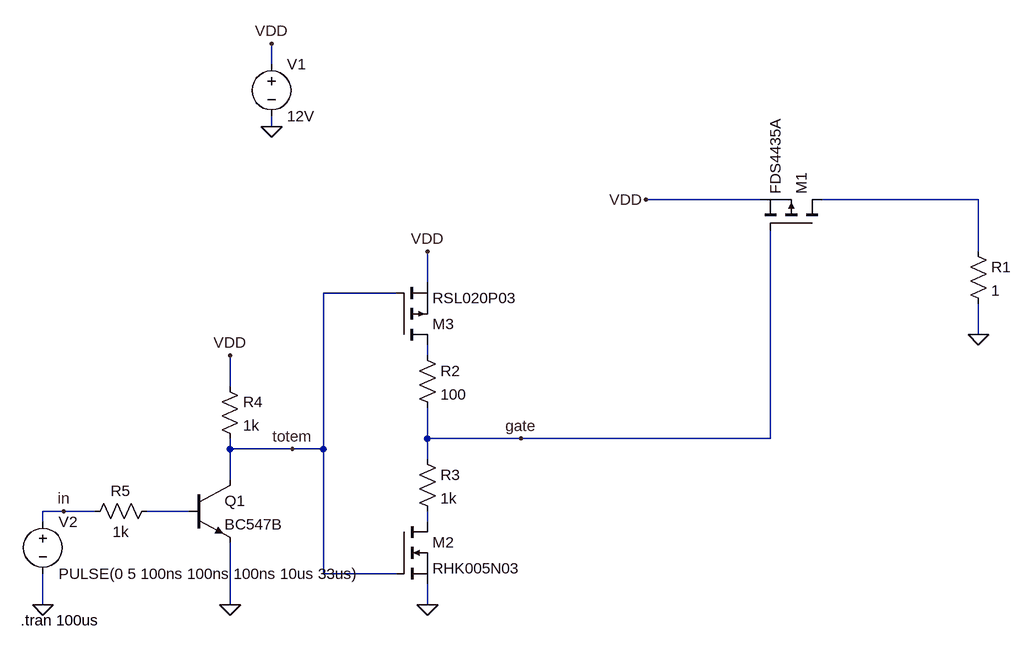
[diagram p0: schematic pull_push_driver.asc]
pull_push_driver.asc, the LTspice schematic file:
Version 4
SHEET 1 880 680
WIRE -512 -672 -512 -704
WIRE -512 -576 -512 -592
WIRE 240 -464 64 -464
WIRE 576 -464 336 -464
WIRE 576 -384 576 -464
WIRE -272 -336 -272 -384
WIRE -320 -320 -432 -320
WIRE 576 -256 576 -304
WIRE -272 -224 -272 -240
WIRE -576 -176 -576 -224
WIRE -272 -96 -272 -144
WIRE -128 -96 -272 -96
WIRE 256 -96 256 -416
WIRE 256 -96 -128 -96
WIRE -576 -80 -576 -96
WIRE -480 -80 -576 -80
WIRE -432 -80 -432 -320
WIRE -432 -80 -480 -80
WIRE -272 -64 -272 -96
WIRE -576 -32 -576 -80
WIRE -832 16 -864 16
WIRE -784 16 -832 16
WIRE -640 16 -704 16
WIRE -864 32 -864 16
WIRE -272 32 -272 16
WIRE -432 112 -432 -80
WIRE -320 112 -432 112
WIRE -864 160 -864 112
WIRE -576 160 -576 64
WIRE -272 160 -272 128
FLAG -512 -576 0
FLAG -512 -704 VDD
FLAG 64 -464 VDD
FLAG 576 -256 0
FLAG -272 -384 VDD
FLAG -272 160 0
FLAG -576 -224 VDD
FLAG -576 160 0
FLAG -864 160 0
FLAG -128 -96 gate
FLAG -480 -80 totem
FLAG -832 16 in
SYMBOL pmos 336 -416 M270
SYMATTR InstName M1
SYMATTR Value FDS4435A
SYMBOL voltage -512 -688 R0
WINDOW 123 0 0 Left 2
WINDOW 39 0 0 Left 2
SYMATTR InstName V1
SYMATTR Value 12V
SYMBOL res 560 -400 R0
SYMATTR InstName R1
SYMATTR Value 1
SYMBOL nmos -320 32 R0
SYMATTR InstName M2
SYMATTR Value RHK005N03
SYMBOL pmos -320 -240 M180
SYMATTR InstName M3
SYMATTR Value RSL020P03
SYMBOL res -288 -240 R0
SYMATTR InstName R2
SYMATTR Value 100
SYMBOL res -288 -80 R0
SYMATTR InstName R3
SYMATTR Value 1k
SYMBOL npn -640 -32 R0
SYMATTR InstName Q1
SYMATTR Value BC547B
SYMBOL res -592 -192 R0
SYMATTR InstName R4
SYMATTR Value 1k
SYMBOL voltage -864 16 R0
WINDOW 123 0 0 Left 2
WINDOW 39 0 0 Left 2
SYMATTR InstName V2
SYMATTR Value PULSE(0 5 100ns 100ns 100ns 10us 33us)
SYMBOL res -800 32 R270
WINDOW 0 32 56 VTop 2
WINDOW 3 0 56 VBottom 2
SYMATTR InstName R5
SYMATTR Value 1k
TEXT -898 184 Left 2 !.tran 100us

The netlist it stands for:
* pull_push_driver.asc
M1 N001 gate VDD VDD FDS4435A
V1 VDD 0 12V
R1 N001 0 1
M2 N004 totem 0 0 RHK005N03
M3 N002 totem VDD VDD RSL020P03
R2 N002 gate 100
R3 gate N004 1k
Q1 totem N003 0 0 BC547B
R4 VDD totem 1k
V2 in 0 PULSE(0 5 100ns 100ns 100ns 10us 33us)
R5 in N003 1k
.model NPN NPN
.model PNP PNP
.lib standard.bjt
.model NMOS NMOS
.model PMOS PMOS
.lib standard.mos
.tran 100us
.backanno
.end